# Altium schematic sheet PowerSupply.SchDoc
size A3; SheetNumber: 2; SheetTotal: 5
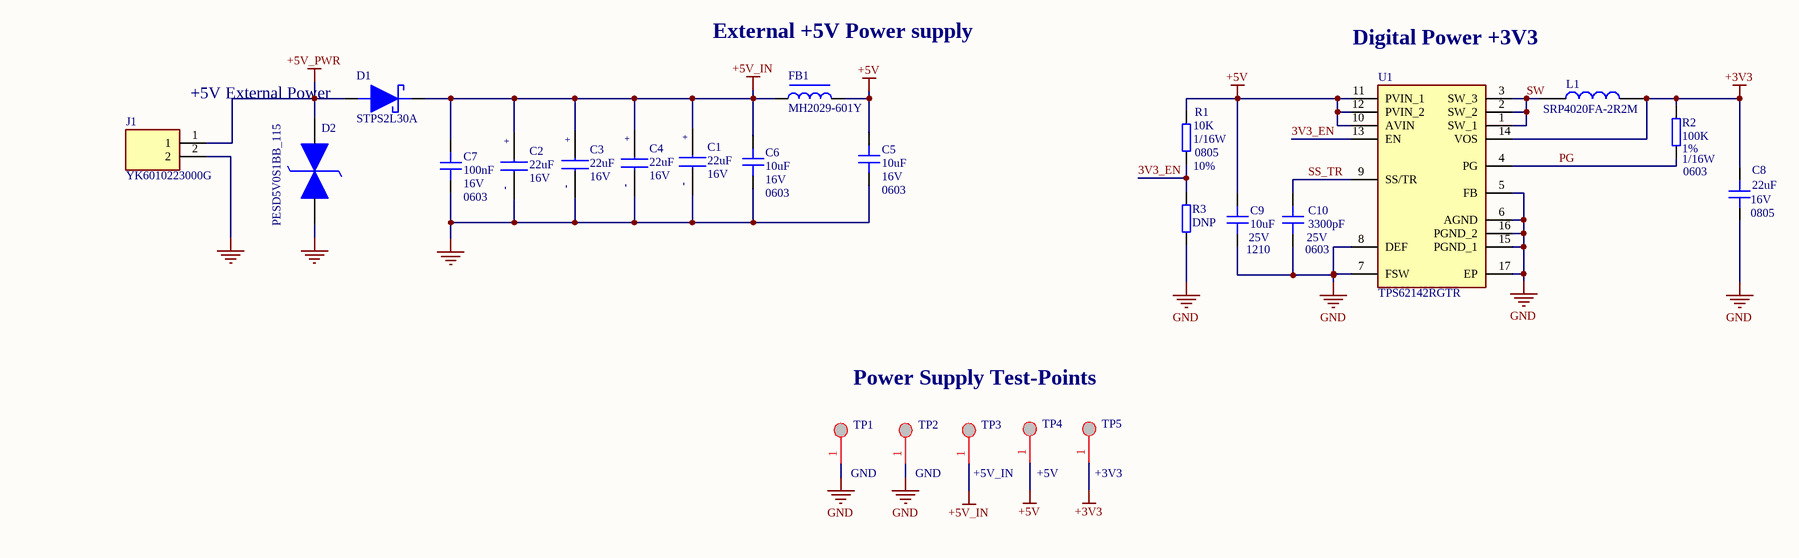
[diagram p0: PowerSupply.SchDoc]

## Parts
C1  value 22uF  Voltage: 16V  [CAPAE530X580N]  (hidden comment: 875105359003)
C2  value 22uF  Voltage: 16V  [CAPAE530X580N]  (hidden comment: 875105359003)
C3  value 22uF  Voltage: 16V  [CAPAE530X580N]  (hidden comment: 875105359003)
C4  value 22uF  Voltage: 16V  [CAPAE530X580N]  (hidden comment: 875105359003)
C5  10uF  Voltage: 16V  Package: 0603  [C0603]
C6  10uF  Voltage: 16V  Package: 0603  [C0603]
C7  100nF  Voltage: 16V  Package: 0603  [C0603]
C8  22uF  Voltage: 16V  Package: 0805  [C0805]
C9  10uF  Voltage: 25V  Package: 1210  [C1210]
C10  3300pF  Voltage: 25V  Package: 0603  [C0603]
D1  STPS2L30A  [SMA_STM]
D2  PESD5V0S1BB_115  [SODFL1608X65N]
FB1  MH2029-601Y  [BEADC2012X110N]
J1  YK6010223000G  [YK6010223000G]
L1  SRP4020FA-2R2M  [SRP4020FA2R2M]
R1  10K  Package: 0805  Tolerence: 10%  Power: 1/16W  [R0805_2012]
R2  100K  Package: 0603  Tolerence: 1%  Power: 1/16W  [R0603_1608]
R3  DNP  [R0805_2012]
TP1  GND  [Test point SDT8]
TP2  GND  [Test point SDT8]
TP3  +5V_IN  [Test point SDT8]
TP4  +5V  [Test point SDT8]
TP5  +3V3  [Test point SDT8]
U1  TPS62142RGTR  [QFN50P300X300X100-17N-D]

## Nets
+3V3: C8.2 L1.2 R2.2 TP5.1 U1.14(VOS)
+5V: C5.2 C9.2 FB1.2 R1.1 TP4.1 U1.10(AVIN) U1.11(PVIN_1) U1.12(PVIN_2)
+5V_IN: C1.1(+) C2.1(+) C3.1(+) C4.1(+) C6.2 C7.2 D1.1(K) FB1.1 TP3.1
+5V_PWR: D1.2(A) D2.2(K2) J1.1
GND: C1.2(-) C2.2(-) C3.2(-) C4.2(-) C5.1 C6.1 C7.1 C8.1 C9.1 C10.1 D2.1(K1) J1.2 R3.2 TP1.1 TP2.1 U1.5(FB) U1.6(AGND) U1.7(FSW) U1.8(DEF) U1.15(PGND_1) U1.16(PGND_2) U1.17(EP)
3V3_EN: R1.2 R3.1 U1.13(EN)
PG: R2.1 U1.4(PG)
SS_TR: C10.2 U1.9(SS/TR)
SW: L1.1 U1.1(SW_1) U1.2(SW_2) U1.3(SW_3)

## Notes on the sheet
- External +5V Power supply
- Digital Power +3V3
- (near J1) +5V External Power
- Power Supply Test-Points

## Library data of the parts
C1-C4 = 875105359003: WCAP-PSLP Aluminum Polymer Capacitors PSEC058220M016DVCTBB000; SMT V-Chip; 22 F +/- 20%; 16 V(DC); 2000 h; -55C / +105C; size DxL 5.0 x 5.8; ESR 30 m; Max. Iripple 2200 mA @100 kHz; LC 400 A; DF 8 %; Manufacturer_Name: Wurth Elektronik; Geometry.Height: 5.8mm; Manufacturer_Part_Number: 875105359003; Mouser Part Number: 710-875105359003; Mouser Price/Stock: https://www.mouser.co.uk/ProductDetail/Wurth-Elektronik/875105359003?qs=0KOYDY2FL29jQO14iscAeA%3D%3D; Arrow Part Number: *; Arrow Price/Stock: *; Datasheet Link: https://www.we-online.com/catalog/datasheet/875105359003.pdf
C5 C6 = CAP_0603_16V: SMD Capacitor; Tolerance: 10%; Temperature Coefficient: X7R; Designator: ?; Value: 10uF; Dielectric: ?; Manufacturer Reference: ?; Power: ?; Excepted: ?
C7 = CAP_0603_16V: SMD Capacitor; Designator: ?; Value: 100nF; Dielectric: ?; Manufacturer Reference: ?; Tolerance: ?; Power: ?; Excepted: ?
C8 = CAP_0805_16V: SMD Capacitor; Designator: ?; Value: 22uF; Dielectric: ?; Manufacturer Reference: ?; Tolerance: ?; Power: ?; Excepted: ?
C9 = CAP_1210_25V: SMD Capacitor; Designator: ?; Value: 10uF; Dielectric: ?; Manufacturer Reference: ?; Tolerance: ?; Power: ?; Excepted: ?
C10 = CAP_0603_25V: SMD Capacitor; Designator: ?; Value: 3300pF; Dielectric: ?; Manufacturer Reference: ?; Tolerance: ?; Power: ?; Excepted: ?
D1 = STPS2L30A: 30 V, 2 A Low Drop Power Schottky Rectifier; Manufacturer_Name: STMicroelectronics; Copyright: Copyright (C) 2025 Ultra Librarian. All rights reserved.; Manufacturer_Part_Number: STPS2L30A
D2 = PESD5V0S1BB_115: PESD5V0S1BB - Bidirectional ESD protection diode; Manufacturer_Name: Nexperia; Manufacturer_Part_Number: PESD5V0S1BB,115; Geometry.Height: 0.65mm; Mouser Part Number: 771-PESD5V0S1BB-T/R; Mouser Price/Stock: https://www.mouser.co.uk/ProductDetail/Nexperia/PESD5V0S1BB115?qs=LOCUfHb8d9vW06zz0pOppQ%3D%3D; Arrow Part Number: PESD5V0S1BB,115; Arrow Price/Stock: https://www.arrow.com/en/products/pesd5v0s1bb115/nexperia?region=nac; Datasheet Link: https://assets.nexperia.com/documents/data-sheet/PESD5V0S1BB.pdf
FB1 = MH2029-601Y: BOURNS - MH2029-601Y - FERRITE, BEAD, 0805, 0.2OHM, 1A; Geometry.Height: 1.1mm; Manufacturer_Name: Bourns; Manufacturer_Part_Number: MH2029-601Y; Mouser Part Number: 652-MH2029-601Y; Mouser Price/Stock: https://www.mouser.co.uk/ProductDetail/Bourns/MH2029-601Y?qs=aqFbwuCjQomuno9nfXC5VQ%3D%3D; Arrow Part Number: MH2029-601Y; Arrow Price/Stock: https://www.arrow.com/en/products/mh2029-601y/bourns?utm_currency=USD&region=europe; Datasheet Link: http://www.bourns.com/docs/Product-Datasheets/mh.pdf
J1 = YK6010223000G: 2 Circuit 0.394" (10.00mm) Barrier Block Connector Screws with Captive Plate 20A  300V PC Pin Through Hole -40C ~ 115C; Manufacturer_Name: Amphenol; Geometry.Height: 20mm; Manufacturer_Part_Number: YK6010223000G; Mouser Part Number: 649-YK60102230J0G; Mouser Price/Stock: https://www.mouser.co.uk/ProductDetail/Amphenol-Anytek/YK6010223000G?qs=Mv7BduZupUhsrUKvI0zJrA%3D%3D; Arrow Part Number: *; Arrow Price/Stock: *; Datasheet Link: https://www.anytek.com.tw/Upload/8YK0006601%E5%B7%B2%E8%9E%8D%E5%90%88-16535753519.pdf
L1 = SRP4020FA-2R2M: Fixed Inductors 2.2uH 20% 8A; Manufacturer_Name: Bourns; Geometry.Height: 2.1mm; Manufacturer_Part_Number: SRP4020FA-2R2M; Mouser Part Number: 652-SRP4020FA-2R2M; Mouser Price/Stock: https://www.mouser.co.uk/ProductDetail/Bourns/SRP4020FA-2R2M?qs=MLItCLRbWswKB3debRJXpA%3D%3D; Arrow Part Number: SRP4020FA-2R2M; Arrow Price/Stock: https://www.arrow.com/en/products/srp4020fa-2r2m/bourns.html?utm_currency=USD&region=nac; Datasheet Link: https://www.bourns.com/docs/Product-Datasheets/SRP4020FA.pdf
R1 R2 = Resistor: SMD Resistor; Voltage: ?; Dielectric: ?; Manufacturer Reference: ?; Excepted: ?
  R1: Designator: ?; Value: 10K
  R2: Value: 100K
R3 = Resistor: SMD Resistor; Tolerence: 1%; Power: 1/16W; Designator: ?; Value: DNP; Voltage: ?; Dielectric: ?; Manufacturer Reference: ?; Package: 0805; Excepted: ?
TP1-TP5 = TEST_P SDT8: Designator: ?; Dielectric: ?; Excepted: ?; Package: ?; Power: ?; Tolerance: ?; Value: ?; Voltage: ?
U1 = TPS62142RGTR: TEXAS INSTRUMENTS - TPS62142RGTR - DC/DC CONV, SYNC BUCK, 2.5MHZ, VQFN-16, Switch step down converter; Geometry.Height: 1mm; Manufacturer_Name: Texas Instruments; Manufacturer_Part_Number: TPS62142RGTR; Mouser Part Number: 595-TPS62142RGTR; Mouser Price/Stock: https://www.mouser.co.uk/ProductDetail/Texas-Instruments/TPS62142RGTR?qs=gXEV9p%2FxLgdJ2ViLpYqiRw%3D%3D; Arrow Part Number: TPS62142RGTR; Arrow Price/Stock: https://www.arrow.com/en/products/tps62142rgtr/texas-instruments?region=nac; Datasheet Link: http://www.ti.com/lit/ds/symlink/tps62140.pdf